# Altium schematic sheet igbt pair.SchDoc
size A; SheetNumber: 2; SheetTotal: 2
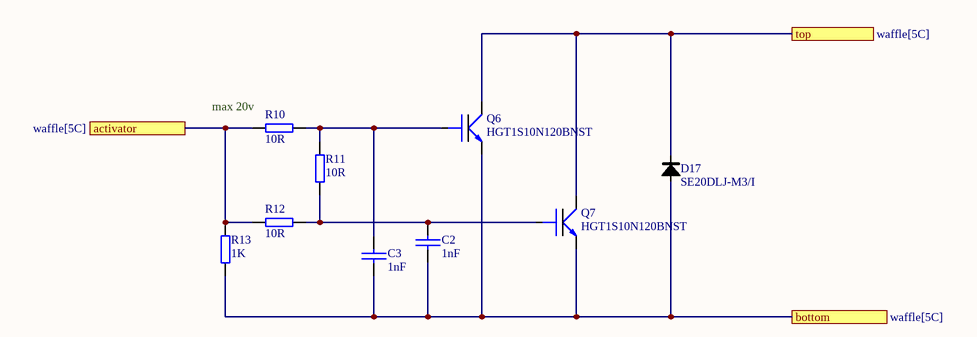
[diagram p0: igbt pair.SchDoc]

## Parts
C2  1nF  [1206]
C3  1nF  [1206]
D17  SE20DLJ-M3/I  [PG-TO252-3 - diode]
Q6  HGT1S10N120BNST  [PG-TO252-3]
Q7  HGT1S10N120BNST  [PG-TO252-3]
R10  10R  [1206]
R11  10R  [1206]
R12  10R  [1206]
R13  1K  [1206]

## Ports
activator (see waffle[5C]), bottom (see waffle[5C]), top (see waffle[5C])

## Nets
activator: R10.1 R12.1 R13.2 ; port activator
bottom: C2.2 C3.2 D17.A Q6.2(E) Q7.2(E) R13.1 ; port bottom
top: D17.K Q6.3(C) Q7.3(C) ; port top
NetC2_1: C2.1 Q7.1(B) R11.1 R12.2
NetC3_1: C3.1 Q6.1(B) R10.2 R11.2

## Notes on the sheet
- (near R10) max 20v

## Library data of the parts
C2 C3 = CAP_1nF: CAPACITOR 1nF 1206; Voltage: 50V; Tolerance: 1-5%; Value: 1nF
D17 = STTH5R06B: Supplier 1: Mouser; Supplier Part Number 1: 78-VS-E5TX3012S2L-M3
Q6 Q7 = FGB20N60SF: IGBT N type 20A(40) 600V dpakpossible replacement STB27NM60ND / FGB20N60SF / RJP6012; Supplier 1: Rs; Supplier Part Number 1: 8076660P; Supplier 2: Mouser; Supplier Part Number 2: 512-HGT1S10N120BNST
R10-R12 = RES_10R: resistor; Power: 1/2W; Tolerance: 1%; Value: 10R
R13 = RES_1K: resistor 1k 1206; Power: 1/2W; Tolerance: 1%; Value: 1K